# Altium schematic sheet Sheet.SchDoc
size A; SheetNumber: 1; SheetTotal: 1
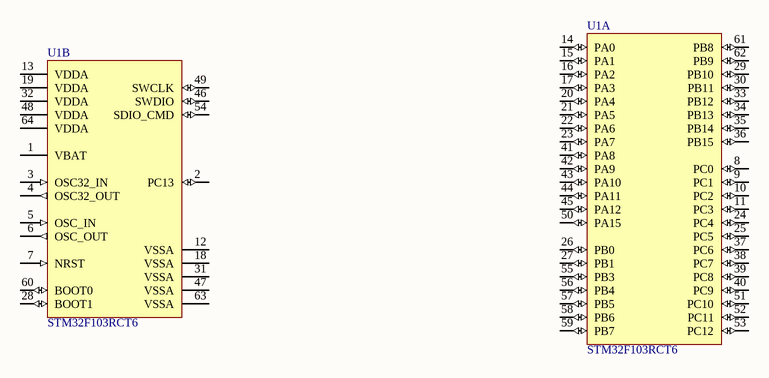
[diagram p0: Sheet.SchDoc]

## Parts
U1  STM32F103RCT6  (parts A,B of 2)

## Nets

Not connected (* = marked no-connect by the designer): U1 1(VBAT) 2(PC13) 3(OSC32_IN) 4(OSC32_OUT) 5(OSC_IN) 6(OSC_OUT) 7(NRST) 8(PC0) 9(PC1) 10(PC2) 11(PC3) 12(VSSA) 13(VDDA) 14(PA0) 15(PA1) 16(PA2) 17(PA3) 18(VSSA) 19(VDDA) 20(PA4) 21(PA5) 22(PA6) 23(PA7) 24(PC4) 25(PC5) 26(PB0) 27(PB1) 28(BOOT1) 29(PB10) 30(PB11) 31(VSSA) 32(VDDA) 33(PB12) 34(PB13) 35(PB14) 36(PB15) 37(PC6) 38(PC7) 39(PC8) 40(PC9) 41(PA8) 42(PA9) 43(PA10) 44(PA11) 45(PA12) 46(SWDIO) 47(VSSA) 48(VDDA) 49(SWCLK) 50(PA15) 51(PC10) 52(PC11) 53(PC12) 54(SDIO_CMD) 55(PB3) 56(PB4) 57(PB5) 58(PB6) 59(PB7) 60(BOOT0) 61(PB8) 62(PB9) 63(VSSA) 64(VDDA)

## Library data of the parts
U1 = STM32F103RCT6: Flash, USB, CAN, 11 timers, 3 ADCs, 13 communication interfaces; Manufacturer: ST; Supplier: LCSC; Supplier Part Number: C8323; Manufacturer Part Number: STM32F103RCT6